# Altium schematic sheet LED.SchDoc
size A4
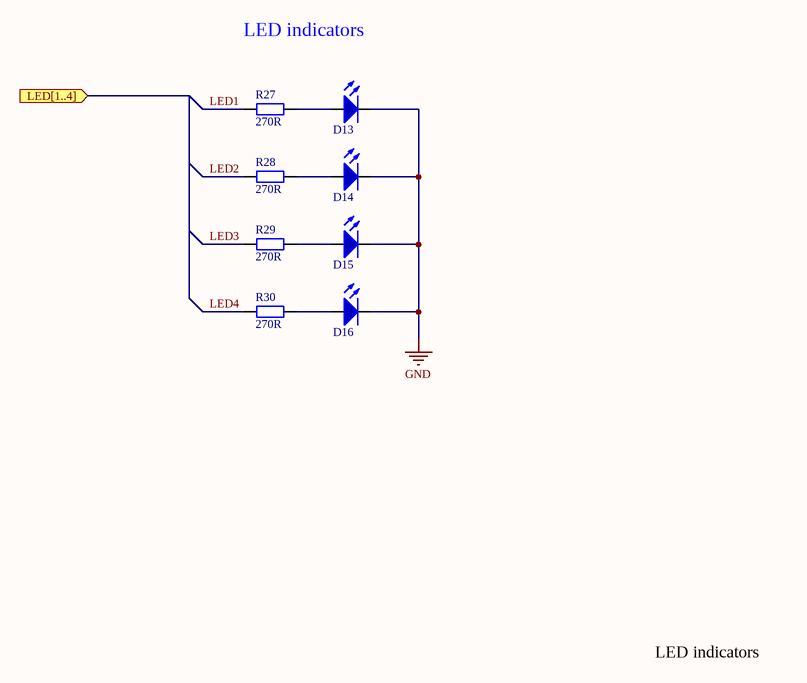
[diagram p0: LED.SchDoc]

## Parts
D13  LED Blue  [LED_0805]  (value not drawn)
D14  LED Blue  [LED_0805]  (value not drawn)
D15  LED Blue  [LED_0805]  (value not drawn)
D16  LED Blue  [LED_0805]  (value not drawn)
R27  270R  [R_0805]
R28  270R  [R_0805]
R29  270R  [R_0805]
R30  270R  [R_0805]

## Ports
LED[1..4] (in)

## Nets
GND: D13.1(-) D14.1(-) D15.1(-) D16.1(-)
LED1: R27.2
LED2: R28.2
LED3: R29.2
LED4: R30.2
NetD13_2: D13.2(+) R27.1
NetD14_2: D14.2(+) R28.1
NetD15_2: D15.2(+) R29.1
NetD16_2: D16.2(+) R30.1

## Notes on the sheet
- LED indicators

## Library data of the parts
R27-R30 = Resistor: Generic resistor; Value: 270R